# Altium schematic sheet LCD.SchDoc: LCD
size A4; DocumentNumber: 7; SheetNumber: 13; SheetTotal: 16
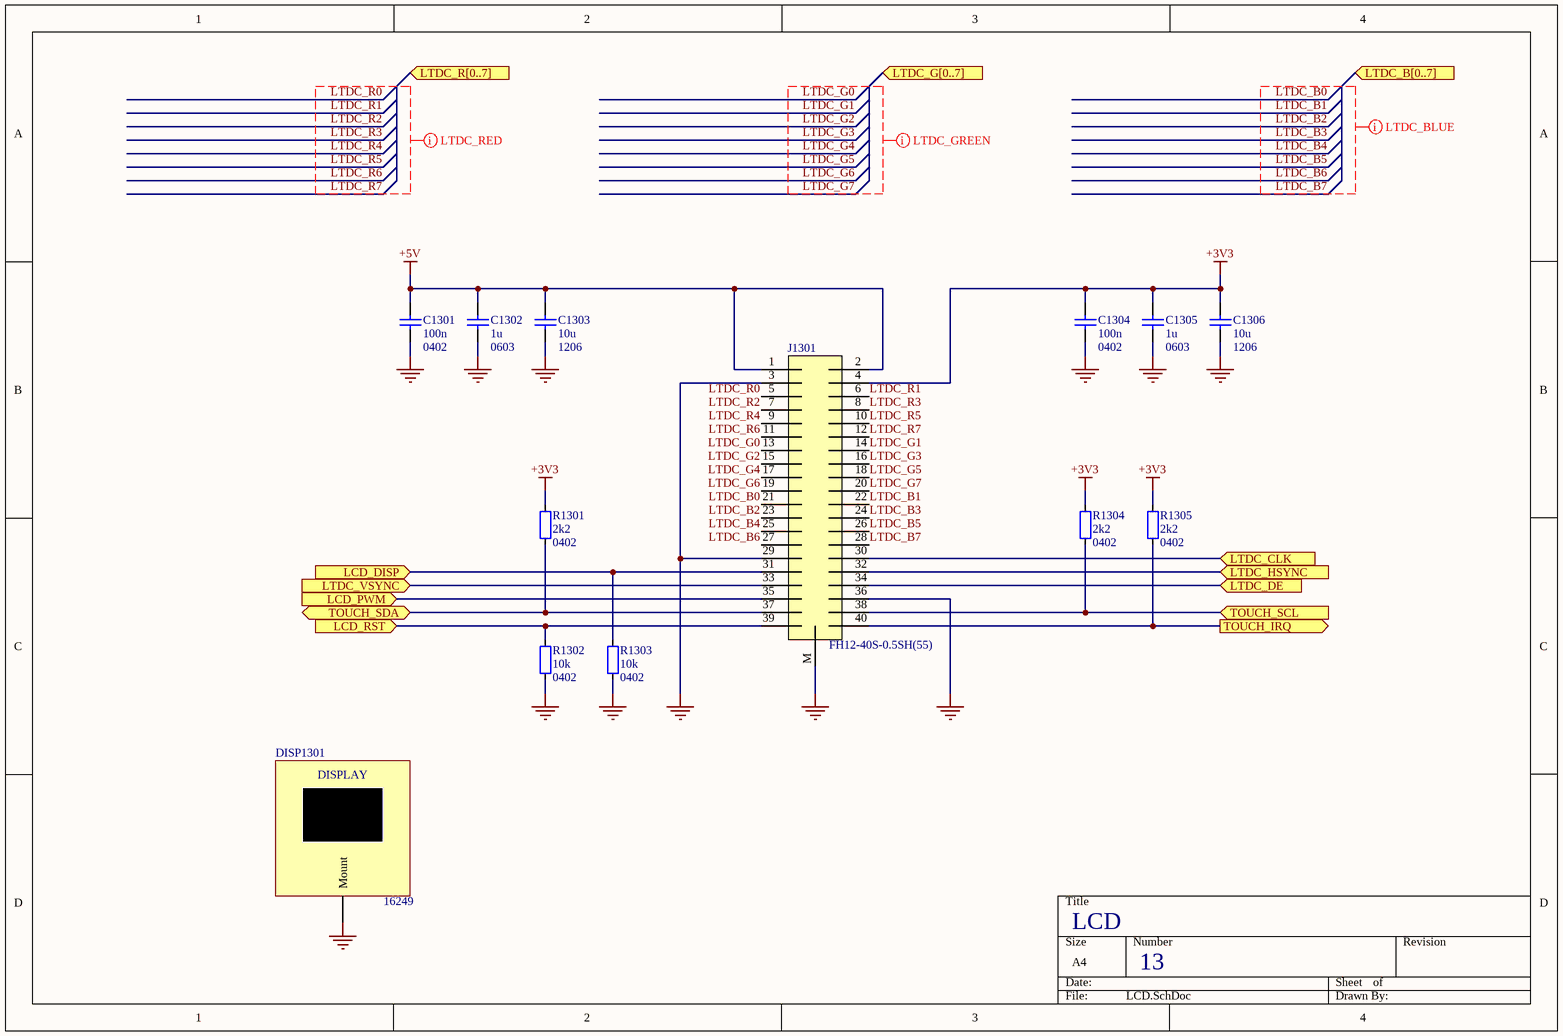
[diagram p0: LCD.SchDoc]

## Parts
C1301  100n  Footprint: 0402  [CAP_0402_B]
C1302  1u  Footprint: 0603  [CAP_0603_B]
C1303  10u  Footprint: 1206  [CAP_1206_B]
C1304  100n  Footprint: 0402  [CAP_0402_B]
C1305  1u  Footprint: 0603  [CAP_0603_B]
C1306  10u  Footprint: 1206  [CAP_1206_B]
DISP1301  16249  [Waveshare_16249]
J1301  FH12-40S-0.5SH(55)  [FH12-40S-0.5SH(55)]
R1301  2k2  Footprint: 0402  [RES_0402_A]
R1302  10k  Footprint: 0402  [RES_0402_A]
R1303  10k  Footprint: 0402  [RES_0402_A]
R1304  2k2  Footprint: 0402  [RES_0402_A]
R1305  2k2  Footprint: 0402  [RES_0402_A]

## Ports
LCD_DISP (in, see Top_Level[2A], MCU[3B]), LCD_PWM (in, see Top_Level[2A], MCU[3B]), LCD_RST (in, see Top_Level[2A], MCU[3B]), LTDC_B[0..7] (in, see Top_Level[2A], MCU[3B]), LTDC_CLK (in, see Top_Level[2A], MCU[3B]), LTDC_DE (in, see Top_Level[2B]), LTDC_G[0..7] (in, see Top_Level[2A], MCU[3B]), LTDC_HSYNC (in, see Top_Level[2A]), LTDC_R[0..7] (in, see Top_Level[2A], MCU[3B]), LTDC_VSYNC (in, see Top_Level[2A]), TOUCH_IRQ (out, see Top_Level[2B], MCU[3C]), TOUCH_SCL (in, see Top_Level[2B], MCU[3C]), TOUCH_SDA (bidir, see Top_Level[2B], MCU[3C])

## Nets
+3V3: C1304.1 C1305.1 C1306.1 J1301.4 R1301.1(a) R1304.1(a) R1305.1(a)
+5V: C1301.1 C1302.1 C1303.1 J1301.1 J1301.2
GND: C1301.2 C1302.2 C1303.2 C1304.2 C1305.2 C1306.2 DISP1301.M(Mount) J1301.3 J1301.29 J1301.36 J1301.M R1302.2(a) R1303.2(a)
LCD_DISP: J1301.31 R1303.1(a) ; port LCD_DISP
LCD_PWM: J1301.35 ; port LCD_PWM
LCD_RST: J1301.39 R1302.1(a) ; port LCD_RST
LTDC_B0: J1301.21
LTDC_B1: J1301.22
LTDC_B2: J1301.23
LTDC_B3: J1301.24
LTDC_B4: J1301.25
LTDC_B5: J1301.26
LTDC_B6: J1301.27
LTDC_B7: J1301.28
LTDC_CLK: J1301.30 ; port LTDC_CLK
LTDC_DE: J1301.34 ; port LTDC_DE
LTDC_G0: J1301.13
LTDC_G1: J1301.14
LTDC_G2: J1301.15
LTDC_G3: J1301.16
LTDC_G4: J1301.17
LTDC_G5: J1301.18
LTDC_G6: J1301.19
LTDC_G7: J1301.20
LTDC_HSYNC: J1301.32 ; port LTDC_HSYNC
LTDC_R0: J1301.5
LTDC_R1: J1301.6
LTDC_R2: J1301.7
LTDC_R3: J1301.8
LTDC_R4: J1301.9
LTDC_R5: J1301.10
LTDC_R6: J1301.11
LTDC_R7: J1301.12
LTDC_VSYNC: J1301.33 ; port LTDC_VSYNC
TOUCH_IRQ: J1301.40 R1305.2(a) ; port TOUCH_IRQ
TOUCH_SCL: J1301.38 R1304.2(a) ; port TOUCH_SCL
TOUCH_SDA: J1301.37 R1301.2(a) ; port TOUCH_SDA

## Layout directives
net class LTDC_RED: LTDC_R0, LTDC_R1, LTDC_R2, LTDC_R3, LTDC_R4, LTDC_R5, LTDC_R6, LTDC_R7
net class LTDC_GREEN: LTDC_G0, LTDC_G1, LTDC_G2, LTDC_G3, LTDC_G4, LTDC_G5, LTDC_G6, LTDC_G7
net class LTDC_BLUE: LTDC_B0, LTDC_B1, LTDC_B2, LTDC_B3, LTDC_B4, LTDC_B5, LTDC_B6, LTDC_B7

## Notes on the sheet
- (in symbol Waveshare_16249) DISPLAY

## Library data of the parts
C1301 C1304 = CAP_0402: 0402 SMD Capacitor
C1302 C1305 = CAP_0603: 0603 SMD Capacitor
C1303 C1306 = CAP_1206: 1206 SMD Capacitor
DISP1301 = Waveshare_16249: Connector for Waveshare 16249 Display.
J1301 = FH12-40S-0.5SH(55): 40 Position FFC, FPC Connector Contacts, Bottom 0.020" (0.50mm) Surface Mount, Right Angle; Supplier 1: Future Electronics; Supplier Part Number 1: FH12-40S-0.5SH(55)
R1301-R1305 = RES_0402: 0402 SMD Resistor